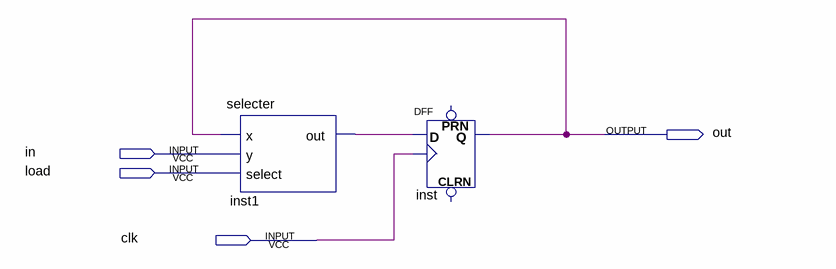
[diagram p0: schematic sheet]
// Quartus schematic register.bdf as structural Verilog: 2 symbols, 4 pins
module register (
  input  in,
  input  load,
  input  clk,
  output out
);

  wire inst1_out;

  selecter inst1 (.x(out), .y(in), .select(load), .out(inst1_out));
  DFF inst (.CLK(clk), .D(inst1_out), .Q(out));  // open: CLRN, PRN
endmodule
